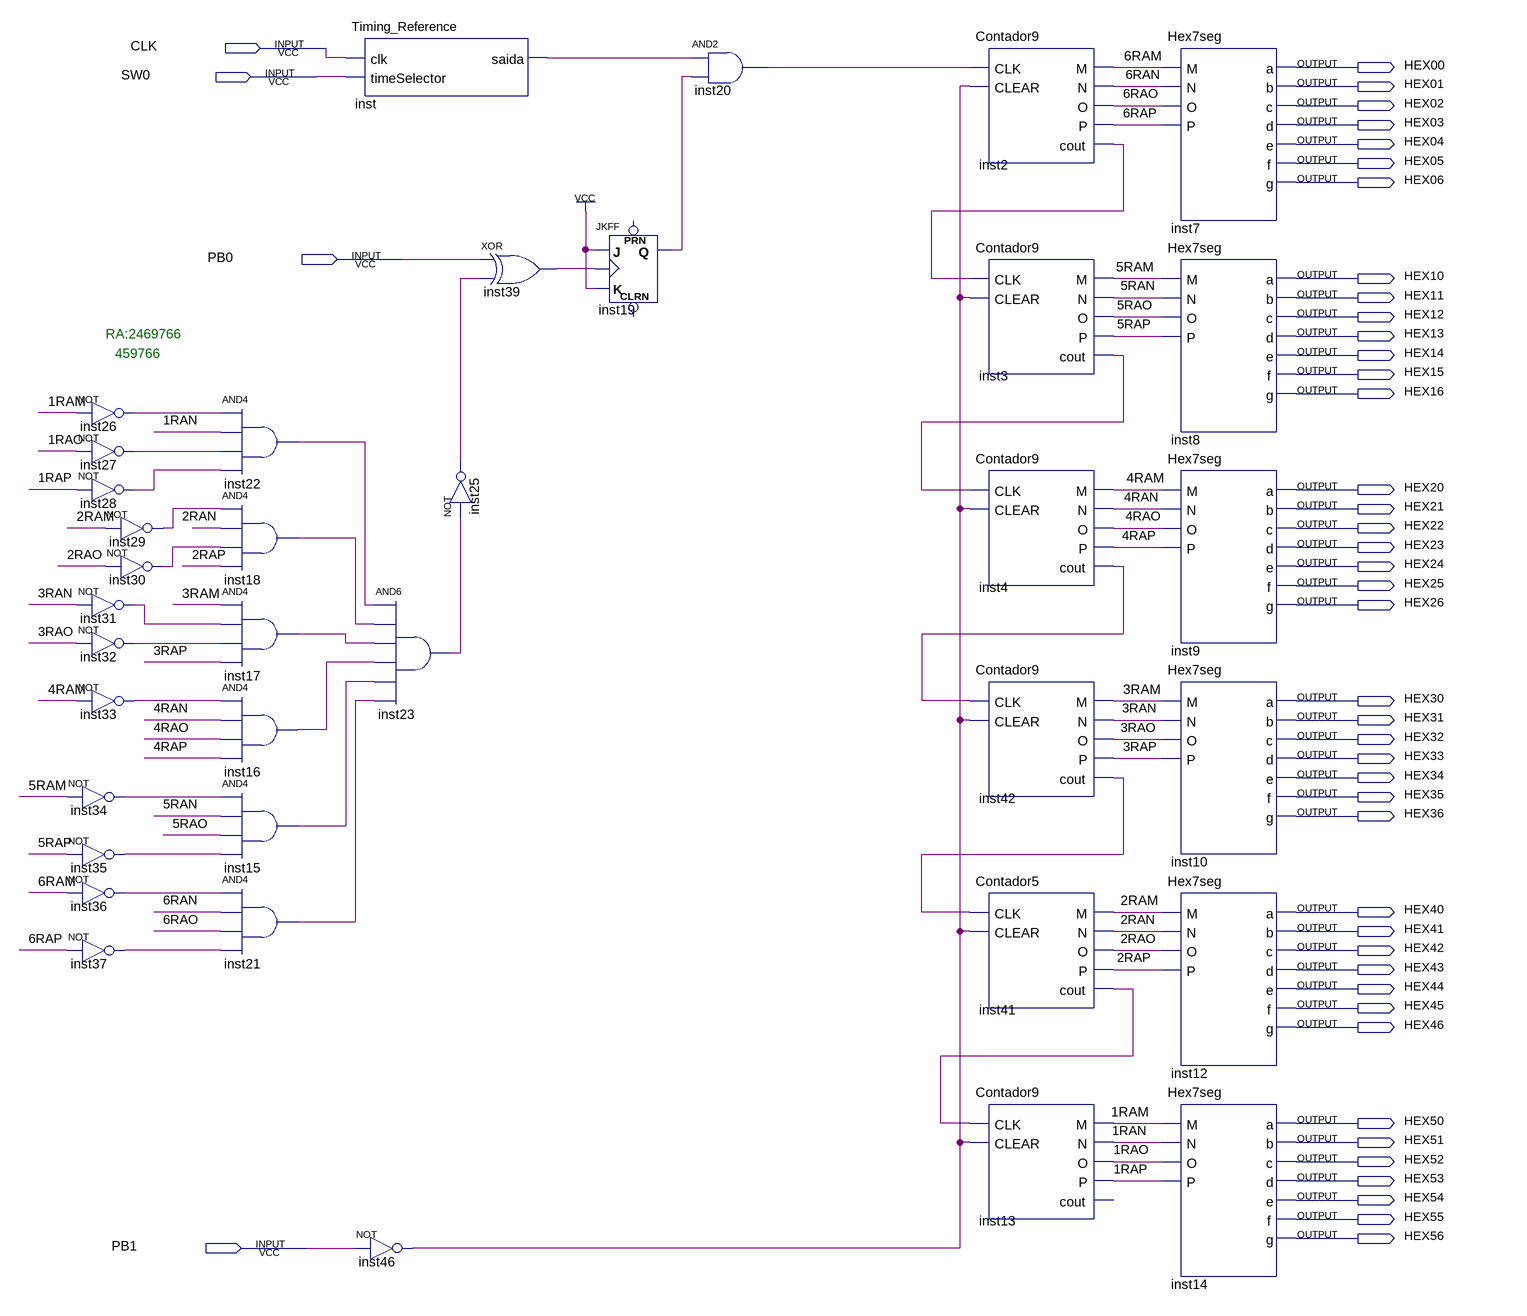
[diagram p0: schematic sheet]
// Quartus schematic Lab4.bdf as structural Verilog: 37 symbols, 46 pins
module Lab4 (
  input  CLK,
  input  SW0,
  input  PB0,
  input  PB1,
  output HEX00,
  output HEX01,
  output HEX02,
  output HEX03,
  output HEX04,
  output HEX05,
  output HEX06,
  output HEX10,
  output HEX11,
  output HEX12,
  output HEX13,
  output HEX14,
  output HEX15,
  output HEX16,
  output HEX20,
  output HEX21,
  output HEX22,
  output HEX23,
  output HEX24,
  output HEX25,
  output HEX26,
  output HEX30,
  output HEX31,
  output HEX32,
  output HEX33,
  output HEX34,
  output HEX35,
  output HEX36,
  output HEX40,
  output HEX41,
  output HEX42,
  output HEX43,
  output HEX44,
  output HEX45,
  output HEX46,
  output HEX50,
  output HEX51,
  output HEX52,
  output HEX53,
  output HEX54,
  output HEX55,
  output HEX56
);

  wire \1RAM , \1RAN , \1RAO , \1RAP , \2RAM , \2RAN , \2RAO , \2RAP , \3RAM , \3RAN , \3RAO , \3RAP ,
       \4RAM , \4RAN , \4RAO , \4RAP , \5RAM , \5RAN , \5RAO , \5RAP , \6RAM , \6RAN , \6RAO , \6RAP ,
       inst2_cout, inst3_cout, inst4_cout, inst15_out, inst16_out, inst17_out, inst18_out, inst19_q,
       inst20_out, inst21_out, inst22_out, inst23_out, inst25_out, inst26_out, inst27_out, inst28_out,
       inst29_out, inst30_out, inst31_out, inst32_out, inst33_out, inst34_out, inst35_out, inst36_out,
       inst37_out, inst39_out, inst41_cout, inst42_cout, inst46_out, inst_saida;

  not inst26 (inst26_out, \1RAM );
  not inst27 (inst27_out, \1RAO );
  not inst28 (inst28_out, \1RAP );
  not inst29 (inst29_out, \2RAM );
  not inst30 (inst30_out, \2RAO );
  not inst31 (inst31_out, \3RAN );
  not inst32 (inst32_out, \3RAO );
  not inst33 (inst33_out, \4RAM );
  not inst34 (inst34_out, \5RAM );
  not inst35 (inst35_out, \5RAP );
  not inst36 (inst36_out, \6RAM );
  not inst37 (inst37_out, \6RAP );
  and inst22 (inst22_out, inst26_out, \1RAN , inst27_out, inst28_out);
  and inst18 (inst18_out, inst29_out, \2RAN , inst30_out, \2RAP );
  and inst17 (inst17_out, \3RAM , inst31_out, inst32_out, \3RAP );
  and inst16 (inst16_out, inst33_out, \4RAN , \4RAO , \4RAP );
  and inst15 (inst15_out, inst34_out, \5RAN , \5RAO , inst35_out);
  and inst21 (inst21_out, inst36_out, \6RAN , \6RAO , inst37_out);
  Timing_Reference inst (.clk(CLK), .timeSelector(SW0), .saida(inst_saida));
  not inst46 (inst46_out, PB1);
  and inst23 (inst23_out, inst22_out, inst18_out, inst17_out, inst16_out, inst15_out, inst21_out);
  xor inst39 (inst39_out, PB0, inst25_out);
  not inst25 (inst25_out, inst23_out);
  JKFF inst19 (.K(1'b1), .J(1'b1), .CLK(inst39_out), .Q(inst19_q));  // open: PRN, CLRN
  and inst20 (inst20_out, inst_saida, inst19_q);
  Contador9 inst2 (
    .CLK(inst20_out), .CLEAR(inst46_out), .M(\6RAM ), .N(\6RAN ), .O(\6RAO ), .P(\6RAP ), .cout(inst2_cout));
  Contador9 inst3 (
    .CLK(inst2_cout), .CLEAR(inst46_out), .M(\5RAM ), .N(\5RAN ), .O(\5RAO ), .P(\5RAP ), .cout(inst3_cout));
  Contador9 inst4 (
    .CLK(inst3_cout), .CLEAR(inst46_out), .M(\4RAM ), .N(\4RAN ), .O(\4RAO ), .P(\4RAP ), .cout(inst4_cout));
  Contador9 inst42 (
    .CLK(inst4_cout), .CLEAR(inst46_out), .M(\3RAM ), .N(\3RAN ), .O(\3RAO ), .P(\3RAP ), .cout(inst42_cout));
  Contador5 inst41 (
    .CLK(inst42_cout), .CLEAR(inst46_out), .M(\2RAM ), .N(\2RAN ), .O(\2RAO ), .P(\2RAP ), .cout(inst41_cout));
  Contador9 inst13 (
    .CLK(inst41_cout), .CLEAR(inst46_out), .M(\1RAM ), .N(\1RAN ), .O(\1RAO ), .P(\1RAP ));  // open: cout
  Hex7seg inst7 (
    .M(\6RAM ), .N(\6RAN ), .O(\6RAO ), .P(\6RAP ), .a(HEX00), .b(HEX01), .c(HEX02), .d(HEX03), .e(HEX04),
    .f(HEX05), .g(HEX06));
  Hex7seg inst8 (
    .M(\5RAM ), .N(\5RAN ), .O(\5RAO ), .P(\5RAP ), .a(HEX10), .b(HEX11), .c(HEX12), .d(HEX13), .e(HEX14),
    .f(HEX15), .g(HEX16));
  Hex7seg inst9 (
    .M(\4RAM ), .N(\4RAN ), .O(\4RAO ), .P(\4RAP ), .a(HEX20), .b(HEX21), .c(HEX22), .d(HEX23), .e(HEX24),
    .f(HEX25), .g(HEX26));
  Hex7seg inst10 (
    .M(\3RAM ), .N(\3RAN ), .O(\3RAO ), .P(\3RAP ), .a(HEX30), .b(HEX31), .c(HEX32), .d(HEX33), .e(HEX34),
    .f(HEX35), .g(HEX36));
  Hex7seg inst12 (
    .M(\2RAM ), .N(\2RAN ), .O(\2RAO ), .P(\2RAP ), .a(HEX40), .b(HEX41), .c(HEX42), .d(HEX43), .e(HEX44),
    .f(HEX45), .g(HEX46));
  Hex7seg inst14 (
    .M(\1RAM ), .N(\1RAN ), .O(\1RAO ), .P(\1RAP ), .a(HEX50), .b(HEX51), .c(HEX52), .d(HEX53), .e(HEX54),
    .f(HEX55), .g(HEX56));

  // Notes on the sheet:
  //   RA:2469766
  //   459766
endmodule
